# EAGLE design Domofon (EAGLE 9.4.2)
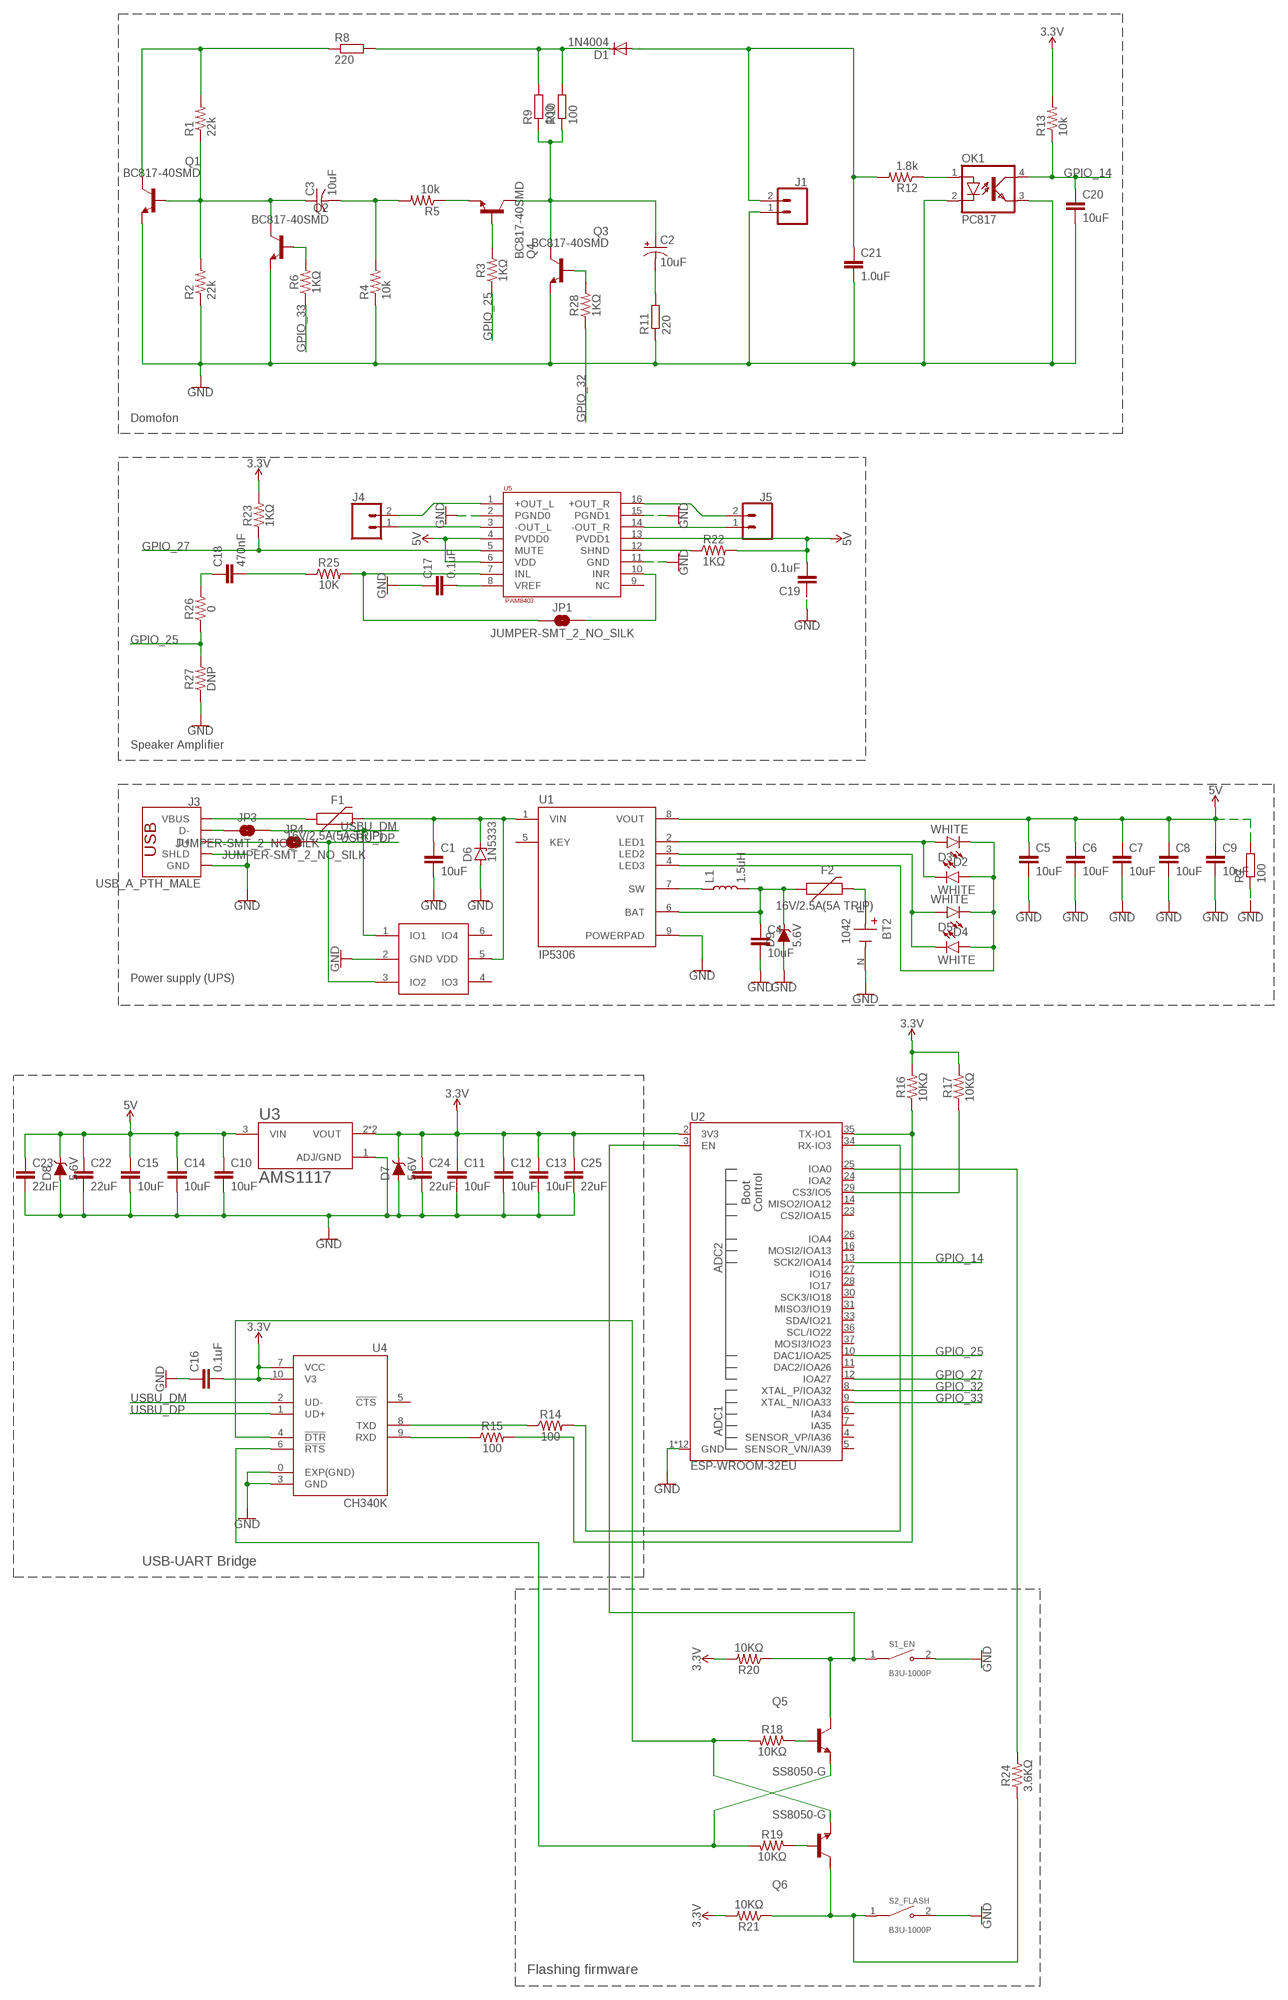
[diagram p0: schematic, sheet 1]

## Parts
BT2  1042  [BAT_1042]
C1  10uF  10UF-0603-6.3V-20%  [0603]
C2  10uF  10UF-POLAR-RADIAL-2.5MM-25V-20%  [CPOL-RADIAL-2.5MM-5MM]
C3  10uF  C-US025-024X044  [C025-024X044]
C4  10uF  10UF-0603-6.3V-20%  [0603]
C5  10uF  10UF-0603-6.3V-20%  [0603]
C6  10uF  10UF-0603-6.3V-20%  [0603]
C7  10uF  10UF-0603-6.3V-20%  [0603]
C8  10uF  10UF-0603-6.3V-20%  [0603]
C9  10uF  10UF-0603-6.3V-20%  [0603]
C10  10uF  10UF-0603-6.3V-20%  [0603]
C11  10uF  10UF-0603-6.3V-20%  [0603]
C12  10uF  10UF-0603-6.3V-20%  [0603]
C13  10uF  10UF-0603-6.3V-20%  [0603]
C14  10uF  10UF-0603-6.3V-20%  [0603]
C15  10uF  10UF-0603-6.3V-20%  [0603]
C16  0.1uF  0.1UF-0402-10V-10%-X7R  [0402]
C17  0.1uF  0.1UF-0402-10V-10%-X7R  [0402]
C18  470nF  470NF-0402-16V-10%  [0402]
C19  0.1uF  0.1UF-0402-10V-10%-X7R  [0402]
C20  10uF  10UF-0603-6.3V-20%  [0603]
C21  1.0uF  1.0UF-0603-16V-10%  [0603]
C22  22uF  22UF-1206-50V-10%  [1206]
C23  22uF  22UF-1206-50V-10%  [1206]
C24  22uF  22UF-1206-50V-10%  [1206]
C25  22uF  22UF-1206-50V-10%  [1206]
D1  1N4004  [DO41-10]
D2  WHITE  LED-WHITE0603  [LED-0603]
D3  WHITE  LED-WHITE0603  [LED-0603]
D4  WHITE  LED-WHITE0603  [LED-0603]
D5  WHITE  LED-WHITE0603  [LED-0603]
D6  1N5333  [C1702-15]
D7  5.6V  DIODE-ZENER-MMSZ5232BS  [SOD-323]
D8  5.6V  DIODE-ZENER-MMSZ5232BS  [SOD-323]
D9  5.6V  DIODE-ZENER-MMSZ5232BS  [SOD-323]
F1  16V/2.5A(5A TRIP)  PPTC_16V_2.5A  [1812]
F2  16V/2.5A(5A TRIP)  PPTC_16V_2.5A  [1812]
J1  CONN_02POLAR_LOCK  [MOLEX-1X2_LOCK]
J3  USB_A_PTH_MALE  [USB-A-H]
J4  CONN_02LOCK_LONGPADS  [1X02_LOCK_LONGPADS]
J5  CONN_02LOCK_LONGPADS  [1X02_LOCK_LONGPADS]
JP1  JUMPER-SMT_2_NO_SILK  [SMT-JUMPER_2_NO_SILK]
JP3  JUMPER-SMT_2_NO_SILK  [SMT-JUMPER_2_NO_SILK]
JP4  JUMPER-SMT_2_NO_SILK  [SMT-JUMPER_2_NO_SILK]
L1  1.5uH  1.5UH-2X2-1.4A  [INDUCTOR_2X2]
OK1  PC817  [DIL04]
Q1  BC817-40SMD  [SOT23-BEC]
Q2  BC817-40SMD  [SOT23-BEC]
Q3  BC817-40SMD  [SOT23-BEC]
Q4  BC817-40SMD  [SOT23-BEC]
Q5  SS8050-G  [TRANS_SS8050-G]
Q6  SS8050-G  [TRANS_SS8050-G]
R1  22k  22KOHM-0603-1/10W-1%  [0603]
R2  22k  22KOHM-0603-1/10W-1%  [0603]
R3  1KΩ  1KOHM-0402T-1/16W-1%  [0402-TIGHT]
R4  10k  10KOHM-0603-1/10W-1%  [0603]
R5  10k  10KOHM-0603-1/10W-1%  [0603]
R6  1KΩ  1KOHM-0402T-1/16W-1%  [0402-TIGHT]
R7  100  R-EU_0411/15  [0411/15]
R8  220  R-EU_0411/15  [0411/15]
R9  100  R-EU_0411/15  [0411/15]
R10  100  R-EU_0411/15  [0411/15]
R11  220  R-EU_0411/15  [0411/15]
R12  1.8k  1.8KOHM-0603-1/10W-1%  [0603]
R13  10k  10KOHM-0603-1/10W-1%  [0603]
R14  100  100OHM-0402-TIGHT-1/16W-1%  [0402-TIGHT]
R15  100  100OHM-0402-TIGHT-1/16W-1%  [0402-TIGHT]
R16  10KΩ  10KOHM-0402T-1/16W-1%  [0402-TIGHT]
R17  10KΩ  10KOHM-0402T-1/16W-1%  [0402-TIGHT]
R18  10KΩ  10KOHM-0402T-1/16W-1%  [0402-TIGHT]
R19  10KΩ  10KOHM-0402T-1/16W-1%  [0402-TIGHT]
R20  10KΩ  10KOHM-0402T-1/16W-1%  [0402-TIGHT]
R21  10KΩ  10KOHM-0402T-1/16W-1%  [0402-TIGHT]
R22  1KΩ  1KOHM-0402T-1/16W-1%  [0402-TIGHT]
R23  1KΩ  1KOHM-0402T-1/16W-1%  [0402-TIGHT]
R24  3.6KΩ  10KOHM-0402T-1/16W-1%  [0402-TIGHT]
R25  10K  10KOHM-0402-1/10W-0.1%  [0402-TIGHT]
R26  0  1KOHM-0603-1/10W-1%  [0603]
R27  DNP  1KOHM-0603-1/10W-1%  [0603]
R28  1KΩ  1KOHM-0402T-1/16W-1%  [0402-TIGHT]
S1_EN  B3U-1000P  [SW_B3U-1000P]
S2_FLASH  B3U-1000P  [SW_B3U-1000P]
U1  IP5306  [SOP127P600X165-9N]
U2  ESP-WROOM-32EU  [ESP-WROOM-32EU]
U3  AMS1117  [SOT229P700X180-4N]
U4  CH340K  [SOP100P600X160-11N]
U5  PAM8403  [SOP-16]
U6  AZC099-04S  [SOT95P275X110-6N]

## Nets
3.3V: C11.1 C12.1 C13.1 C16.2 C24.1 C25.1 D7.C R13.2 R16.2 R17.2 R20.2 R21.2 R23.2 U2.2(3V3) U3.2(VOUT) U3.4(VOUT) U4.7(VCC) U4.10(V3)
5V: C5.1 C6.1 C7.1 C8.1 C9.1 C10.1 C14.1 C15.1 C19.2 C22.1 C23.1 D8.C R7.2 R22.2 U1.8(VOUT) U3.3(VIN) U5.4(PVDD0) U5.6(VDD) U5.13(PVDD1)
GND: BT2.N(NEG) C1.2 C4.2 C5.2 C6.2 C7.2 C8.2 C9.2 C10.2 C11.2 C12.2 C13.2 C14.2 C15.2 C16.1 C17.1 C19.1 C20.2 C21.2 C22.2 C23.2 C24.2 C25.2 D6.A D7.A D8.A D9.A J1.1 J3.GND J3.SHLD1(SHLD) J3.SHLD2(SHLD) OK1.2(C) OK1.3(EMIT) Q1.E Q2.E Q3.E R2.1 R4.1 R7.1 R11.1 R27.1 S1_EN.2 S2_FLASH.2 U1.9(POWERPAD) U2.1(GND) U2.15(GND) U2.38(GND) U2.GND U2.GNDT1(GND) U2.GNDT2(GND) U2.GNDT3(GND) U2.GNDT4(GND) U2.GNDT5(GND) U2.GNDT6(GND) U2.GNDT7(GND) U2.GNDT8(GND) U3.1(ADJ/GND) U4.0(EXP(GND)) U4.3(GND) U5.2(PGND0) U5.11(GND) U5.15(PGND1) U6.2(GND)
GPIO_14: C20.1 OK1.4(COL) R13.1 U2.13(SCK2/IOA14)
GPIO_25: R3.1 R26.1 R27.2 U2.10(DAC1/IOA25)
GPIO_27: R23.1 U2.12(IOA27) U5.5(MUTE)
GPIO_32: R28.1 U2.8(XTAL_P/IOA32)
GPIO_33: R6.1 U2.9(XTAL_N/IOA33)
N$1: C3.1 Q1.B Q2.C R1.1 R2.2
N$2: OK1.1(A) R12.1
N$3: Q1.C R1.2 R8.1
N$4: Q2.B R6.2
N$5: C1.1 D6.C F1.2 U1.1(VIN) U6.5(VDD)
N$6: C3.2 R4.2 R5.2
N$7: D2.A D3.C U1.2(LED1)
N$8: Q4.E R5.1
N$9: Q4.B R3.2
N$10: D2.C D3.A D4.C D5.A U1.4(LED3)
N$11: C2.1(+) Q3.C Q4.C R9.1 R10.1
N$12: Q3.B R28.2
N$13: D4.A D5.C U1.3(LED2)
N$14: Q6.2(E) R18.2 U4.4(!DTR)
N$15: D1.C R8.2 R9.2 R10.2
N$16: C2.2(-) R11.2
N$17: L1.P$1 U1.7(SW)
N$18: C21.1 D1.A J1.2 R12.2
N$19: C4.1 D9.C F2.1 L1.P$2 U1.6(BAT)
N$20: Q5.2(E) R19.2 U4.6(!RTS)
N$21: J3.D- JP3.1
N$22: J3.D+ JP4.1
N$23: R15.2 R16.1 U2.35(TX-IO1)
N$24: R14.2 U2.34(RX-IO3)
N$25: R17.1 U2.29(CS3/IO5)
N$26: Q6.1(B) R19.1
N$27: Q5.1(B) R18.1
N$28: R24.2 U2.25(IOA0)
N$29: Q5.3(C) R20.1 S1_EN.1 U2.3(EN)
N$30: J4.1 U5.3(-OUT_L)
N$31: J4.2 U5.1(+OUT_L)
N$32: J5.1 U5.14(-OUT_R)
N$33: J5.2 U5.16(+OUT_R)
N$34: R22.1 U5.12(SHND)
N$35: Q6.3(C) R21.1 R24.1 S2_FLASH.1
N$36: C17.2 U5.8(VREF)
N$37: JP1.1 R25.2 U5.7(INL)
N$38: R14.1 U4.8(TXD)
N$39: R15.1 U4.9(RXD)
N$40: C18.2 R25.1
N$41: JP1.2 U5.10(INR)
N$42: C18.1 R26.2
N$43: F1.1 J3.VBUS
N$44: BT2.P(POS) F2.2
USBU_DM: JP3.2 U4.2(UD-) U6.1(IO1)
USBU_DP: JP4.2 U4.1(UD+) U6.3(IO2)
Unconnected: U1.5(KEY) U2.4(SENSOR_VP/IA36) U2.5(SENSOR_VN/IA39) U2.6(IA34) U2.7(IA35) U2.11(DAC2/IOA26) U2.14(MISO2/IOA12) U2.16(MOSI2/IOA13) U2.23(CS2/IOA15) U2.24(IOA2) U2.26(IOA4) U2.27(IO16) U2.28(IO17) U2.30(SCK3/IO18) U2.31(MISO3/IO19) U2.33(SDA/IO21) U2.36(SCL/IO22) U2.37(MOSI3/IO23) U4.5(!CTS) U5.9(NC) U6.4(IO3) U6.6(IO4)

## Notes on the sheet
- Domofon
- Speaker Amplifier
- Power supply (UPS)
- USB-UART Bridge
- Flashing firmware

## Library data of the parts
BT2 = 1042:1042: Check availability <https://pricing.snapeda.com/parts/1042/Keystone%20Electronics%20Corp./view-part?ref=eda>; AVAILABILITY: In Stock; CHECK_PRICES: https://www.snapeda.com/parts/1042/Keystone/view-part/?ref=eda; DESCRIPTION: SMT Holder for 18650 Battery; MF: Keystone Electronics Corp.; MP: 1042; PACKAGE: NON STANDARD-5 Keystone; PRICE: None; SNAPEDA_LINK: https://www.snapeda.com/parts/1042/Keystone/view-part/?ref=snap
C1 C4-C15 C20 = SparkFun-Capacitors:10UF: 10.0µF ceramic capacitors A capacitor is a passive two-terminal electrical component used to store electrical energy temporarily in an electric field.; PCBWAY_MPN: GRM185R60J106ME15D; PROD_ID: CAP-11015
C2 = SparkFun-Capacitors:10UF-POLAR: 10.0µF polarized capacitors A capacitor is a passive two-terminal electrical component used to store electrical energy temporarily in an electric field.; PROD_ID: CAP-08440
C3 = resistor:C-US: CAPACITOR, American symbol
C16 C17 C19 = SparkFun-Capacitors:0.1UF: 0.1µF ceramic capacitors A capacitor is a passive two-terminal electrical component used to store electrical energy temporarily in an electric field.; PROD_ID: CAP-15083
C18 = SparkFun-Capacitors:470NF: 0.47uF/470nF ceramic capacitors A capacitor is a passive two-terminal electrical component used to store electrical energy temporarily in an electric field.; PROD_ID: CAP-09041
C21 = SparkFun-Capacitors:1.0UF: 1µF ceramic capacitors A capacitor is a passive two-terminal electrical component used to store electrical energy temporarily in an electric field.; PROD_ID: CAP-00868
C22-C25 = SparkFun-Capacitors:22UF: 22µF ceramic capacitors A capacitor is a passive two-terminal electrical component used to store electrical energy temporarily in an electric field.; PROD_ID: CAP-15263
D1 = diode:1N4004: DIODE general purpose rectifier, 1 A
D2-D5 = SparkFun-LED:LED-WHITE: White SMD LED Used in manufacturing several products at SparkFun. Packages: 0603 - Bright White SMD 0603 package[Product Link] <http://www.kingbrightusa.com/product.asp?catalog_name=LED&product_id=APT1608QWF/D> 1206 - Bright White SMD1206 package [Product Link] <http://www.kingbrightusa.com/product.asp?catalog_name=LED&product_id=APT3216QWF/D> 3014 - Super Bright SMD 3014 package [Datasheet] <http://www.lumileds.com/uploads/459/DS208-pdf> SparkFun Products: Blackberry Trackballer Breakout <https://www.sparkfun.com/products/13169> Digital SandBox <https://www.sparkfun.com/products/12651>; PROD_ID: DIO-09004
D6 = diode:1N5333: Z DIODE 3.3 V, 5W, 5 percent (Motorola)
D7-D9 = SparkFun-DiscreteSemi:DIODE-ZENER: Zener Diode A Zener diode allows current to flow from its anode to its cathode like a normal semiconductor diode, but it also permits current to flow in the reverse direction when its "Zener voltage" is reached. - WIkipedia; PROD_ID: DIO-12442
F1 F2 = SparkFun-Fuses:PPTC: Resettable Fuse PPTC Resettable Fuse. Really a sort of resistor with a polymeric positive temperature coefficient whose resistance increases dramatically with an increase in temperature. When heated by the power passing through the resistance rises causing the current to be limited, protecting the circuit. This is achieved by the transition of the polymer from a crystalline to an amorphous state where the conductive carbon separates breaking the conductive pathways found in the cool crystalline structure. When a PPTC cools back down it resumes conducting letting the circuit turn back on. SparkFun Products: SparkFun RedBoard - Programmed with Arduino <https://www.sparkfun.com/products/12757> Pro Micro - 5V/16MHz <https://www.sparkfun.com/products/12640> Arduino Pro 328 - 5V/16MHz <https://www.sparkfun.com/products/10915> MP3 Trigger <https://www.sparkfun.com/products/13720>; PROD_ID: RES-14390
J1 = SparkFun-Connectors:CONN_02: Multi connection point. Often used as Generic Header-pin footprint for 0.1 inch spaced/style header connections On any of the 0.1 inch spaced packages, you can populate with these: Break Away Headers - Straight <https://www.sparkfun.com/products/116> (PRT-00116) Break Away Male Headers - Right Angle <https://www.sparkfun.com/products/553> (PRT-00553) Female Headers <https://www.sparkfun.com/products/115> (PRT-00115) Break Away Headers - Machine Pin <https://www.sparkfun.com/products/117> (PRT-00117) Break Away Female Headers - Swiss Machine Pin <https://www.sparkfun.com/products/743> (PRT-00743) For SCREWTERMINALS and SPRING TERMINALS visit here: Screw Terimnals on SparkFun.com <https://www.sparkfun.com/search/results?term=Screw+Terminals> (5mm/3.5mm/2.54mm spacing) This device is also useful as a general connection point to wire up your design to another part of your project. Our various solder wires solder well into these plated through hole pads. Hook-Up Wire - Assortment (Stranded, 22 AWG) <https://www.sparkfun.com/products/11375> (PRT-11375) Hook-Up Wire - Assortment (Solid Core, 22 AWG) <https://www.sparkfun.com/products/11367> (PRT-11367) View the entire wire category on our website here <https://www.sparkfun.com/categories/141> Special notes: Molex polarized connector foot print use with: PRT-08233 with associated crimp pins and housings. 2.54_SCREWTERM for use with PRT-10571. 3.5mm Screw Terminal footprints for PRT-08084 5mm Screw Terminal footprints for use with PRT-08432; SF_ID: PRT-09918
J3 = SparkFun-Connectors:USB_A: USB-A Connector Male and female variants, as well as PTH and SMT variants SparkFun Products: SparkFun XBee Explorer Dongle <https://www.sparkfun.com/products/11697> PTH Male SparkFun MicroView-USB Programmer <https://www.sparkfun.com/products/12924> SMT Male SparkFun USB Type A Female Breakout <https://www.sparkfun.com/products/12700> SMT Female; PROD_ID: CONN-08367; SF_ID: PRT-00437
J4 J5 = SparkFun-Connectors:CONN_02: Multi connection point. Often used as Generic Header-pin footprint for 0.1 inch spaced/style header connections On any of the 0.1 inch spaced packages, you can populate with these: Break Away Headers - Straight <https://www.sparkfun.com/products/116> (PRT-00116) Break Away Male Headers - Right Angle <https://www.sparkfun.com/products/553> (PRT-00553) Female Headers <https://www.sparkfun.com/products/115> (PRT-00115) Break Away Headers - Machine Pin <https://www.sparkfun.com/products/117> (PRT-00117) Break Away Female Headers - Swiss Machine Pin <https://www.sparkfun.com/products/743> (PRT-00743) For SCREWTERMINALS and SPRING TERMINALS visit here: Screw Terimnals on SparkFun.com <https://www.sparkfun.com/search/results?term=Screw+Terminals> (5mm/3.5mm/2.54mm spacing) This device is also useful as a general connection point to wire up your design to another part of your project. Our various solder wires solder well into these plated through hole pads. Hook-Up Wire - Assortment (Stranded, 22 AWG) <https://www.sparkfun.com/products/11375> (PRT-11375) Hook-Up Wire - Assortment (Solid Core, 22 AWG) <https://www.sparkfun.com/products/11367> (PRT-11367) View the entire wire category on our website here <https://www.sparkfun.com/categories/141> Special notes: Molex polarized connector foot print use with: PRT-08233 with associated crimp pins and housings. 2.54_SCREWTERM for use with PRT-10571. 3.5mm Screw Terminal footprints for PRT-08084 5mm Screw Terminal footprints for use with PRT-08432
JP1 JP3 JP4 = SparkFun-Jumpers:JUMPER-SMT_2_NO: Normally open jumper This jumper has two pads in close proximity to each other. Apply solder to close the connection. Round pads are easier to solder for beginners, but are a lot larger. SparkFun Product that uses the round pads: SparkFun EL Sequencer <https://www.sparkfun.com/products/12781>
L1 = SparkFun-Coils:1.5UH: FIXED IND 1.5UH 1.4A 120 MOHM; PROD_ID: NDUC-15405
OK1 = optocoupler:PC817: SHARP OPTO COUPLER; MPN: PC817X4J000F; OC_FARNELL: 9707727; OC_NEWARK: 97K7059
Q1-Q4 = transistor-npn:BC817*: NPN Transistor
Q5 Q6 = SS8050-G:SS8050-G: Bipolar (BJT) Transistor NPN 25 V 1.5 A 100MHz 300 mW Surface Mount SOT-23-3 Check availability <https://pricing.snapeda.com/parts/SS8050-G/Comchip%20Technology/view-part?ref=eda>; AVAILABILITY: In Stock; DESCRIPTION: Bipolar (BJT) Transistor NPN 25 V 1.5 A 100MHz 300 mW Surface Mount SOT-23-3; MF: Comchip Technology; MP: SS8050-G; PACKAGE: TO-236-3 Comchip Technology; PCBWAY_MPN: SS8050-G; PRICE: None; PURCHASE-URL: https://pricing.snapeda.com/search/part/SS8050-G/?ref=eda
R1 R2 = SparkFun-Resistors:22KOHM: 22kΩ resistor A resistor is a passive two-terminal electrical component that implements electrical resistance as a circuit element. Resistors act to reduce current flow, and, at the same time, act to lower voltage levels within circuits. - Wikipedia; PROD_ID: RES-07853
R3 R6 R22 R23 R28 = SparkFun-Resistors:1KOHM: 1kΩ resistor A resistor is a passive two-terminal electrical component that implements electrical resistance as a circuit element. Resistors act to reduce current flow, and, at the same time, act to lower voltage levels within circuits. - Wikipedia; PCBWAY_MPN: RC0402JR-071KL; PROD_ID: RES-14342; VALUE: 1k
R4 R5 R13 = SparkFun-Resistors:10KOHM: 10kΩ resistor A resistor is a passive two-terminal electrical component that implements electrical resistance as a circuit element. Resistors act to reduce current flow, and, at the same time, act to lower voltage levels within circuits. - Wikipedia; PROD_ID: RES-00824
R7-R11 = resistor:R-EU_: RESISTOR, European symbol
R12 = SparkFun-Resistors:1.8KOHM: 1.8kΩ resistor A resistor is a passive two-terminal electrical component that implements electrical resistance as a circuit element. Resistors act to reduce current flow, and, at the same time, act to lower voltage levels within circuits. - Wikipedia; PROD_ID: RES-09119
R14 R15 = SparkFun-Resistors:100OHM: 100Ω resistor A resistor is a passive two-terminal electrical component that implements electrical resistance as a circuit element. Resistors act to reduce current flow, and, at the same time, act to lower voltage levels within circuits. - Wikipedia; PCBWAY_MPN: RC0402JR-071KL; PROD_ID: RES-14962
R16-R21 = SparkFun-Resistors:10KOHM: 10kΩ resistor A resistor is a passive two-terminal electrical component that implements electrical resistance as a circuit element. Resistors act to reduce current flow, and, at the same time, act to lower voltage levels within circuits. - Wikipedia; PCBWAY_MPN: RC0402JR-0710KL; PROD_ID: RES-14241; VALUE: 10k
R24 = SparkFun-Resistors:10KOHM: 10kΩ resistor A resistor is a passive two-terminal electrical component that implements electrical resistance as a circuit element. Resistors act to reduce current flow, and, at the same time, act to lower voltage levels within circuits. - Wikipedia; PCBWAY_MPN: RC0402FR-073K6L; PROD_ID: RES-14241; VALUE: 10k
R25 = SparkFun-Resistors:10KOHM: 10kΩ resistor A resistor is a passive two-terminal electrical component that implements electrical resistance as a circuit element. Resistors act to reduce current flow, and, at the same time, act to lower voltage levels within circuits. - Wikipedia; PROD_ID: RES-16147
R26 R27 = SparkFun-Resistors:1KOHM: 1kΩ resistor A resistor is a passive two-terminal electrical component that implements electrical resistance as a circuit element. Resistors act to reduce current flow, and, at the same time, act to lower voltage levels within circuits. - Wikipedia; PROD_ID: RES-07856; VALUE: 1k
S1_EN S2_FLASH = B3U-1000P:B3U-1000P: Switch Tactile N.O. SPST Round Button Gull Wing 0.05A 12VDC 1.5N SMD Embossed T/R Check availability <https://pricing.snapeda.com/parts/B3U-1000P/Omron/view-part?ref=eda>; AVAILABILITY: In Stock; DESCRIPTION: Tactile Switch SPST-NO Top Actuated Surface Mount; MF: Omron; MP: B3U-1000P; PACKAGE: Custom Package Omron; PCBWAY_MPN: B3U-1000P; PRICE: None; PURCHASE-URL: https://pricing.snapeda.com/search/part/B3U-1000P/?ref=eda
U1 = IP5306:IP5306: Check availability <https://pricing.snapeda.com/parts/IP5306/Injoinic/view-part?ref=eda>; AVAILABILITY: In Stock; CHECK_PRICES: https://www.snapeda.com/parts/IP5306/Injoinic/view-part/?ref=eda; DESCRIPTION: Fully-Integrated Power Bank System-On-Chip with 2.1A charger, 2.4A discharger; MF: Injoinic; MP: IP5306; PACKAGE: eSOP8 INJOINIC; PRICE: None; SNAPEDA_LINK: https://www.snapeda.com/parts/IP5306/Injoinic/view-part/?ref=snap
U2 = SparkFun-RF:ESP-WROOM-32: ESP-WROOM-32D - trace antenna (includes keepout) ESP-WROOM-32U - U.FL antenna connector Includes both "standard" footprints and "narrow" version (for use with tighter layouts).; PCBWAY_MPN: ESP-WROOM-32E(4MB); PROD_ID: IC-15442
U3 = AMS1117:AMS1117: Sot223/Pkg 1-Amp 5-Volt Low Drop Out Voltage Regulatator Check availability <https://pricing.snapeda.com/parts/AMS1117/Advanced%20Monolithic%20Systems/view-part?ref=eda>; AVAILABILITY: Not in stock; DESCRIPTION: 1A LOW DROPOUT VOLTAGE REGULATOR SOT-223; MF: Advanced Monolithic Systems; MP: AMS1117; PACKAGE: SOT-223 Seeed Technology; PCBWAY_MPN: AMS1117-3.3; PRICE: None
U4 = CH340K:CH340K: Check availability <https://pricing.snapeda.com/parts/CH340K/WCH/view-part?ref=eda>; AVAILABILITY: Not in stock; CHECK_PRICES: https://www.snapeda.com/parts/CH340K/WCH/view-part/?ref=eda; DESCRIPTION: USB to Serial Port Chip; MF: WCH; MP: CH340K; PACKAGE: Package; PRICE: None; SNAPEDA_LINK: https://www.snapeda.com/parts/CH340K/WCH/view-part/?ref=snap
U5 = PAM8403:PAM8403: Check availability <https://pricing.snapeda.com/parts/PAM8403/Diodes%20Zetex/view-part?ref=eda>; AVAILABILITY: In Stock; CHECK_PRICES: https://www.snapeda.com/parts/PAM8403/Diodes+Inc./view-part/?ref=eda; DESCRIPTION: Audio Amp Speaker 2-CH Stereo 3.2W Class-D 16-Pin SOP T/R; MF: Diodes Zetex; MP: PAM8403; PACKAGE: None; PRICE: None; PURCHASE-URL: https://www.snapeda.com/api/url_track_click_mouser/?unipart_id=12621970&manufacturer=Diodes Zetex&part_name=PAM8403&search_term=pam8403; SNAPEDA_LINK: https://www.snapeda.com/parts/PAM8403/Diodes+Inc./view-part/?ref=snap
U6 = SamacSys_Parts:AZC099-04S

## Net classes
0 default: width 0.457 mm, clearance 0.406 mm

## Board
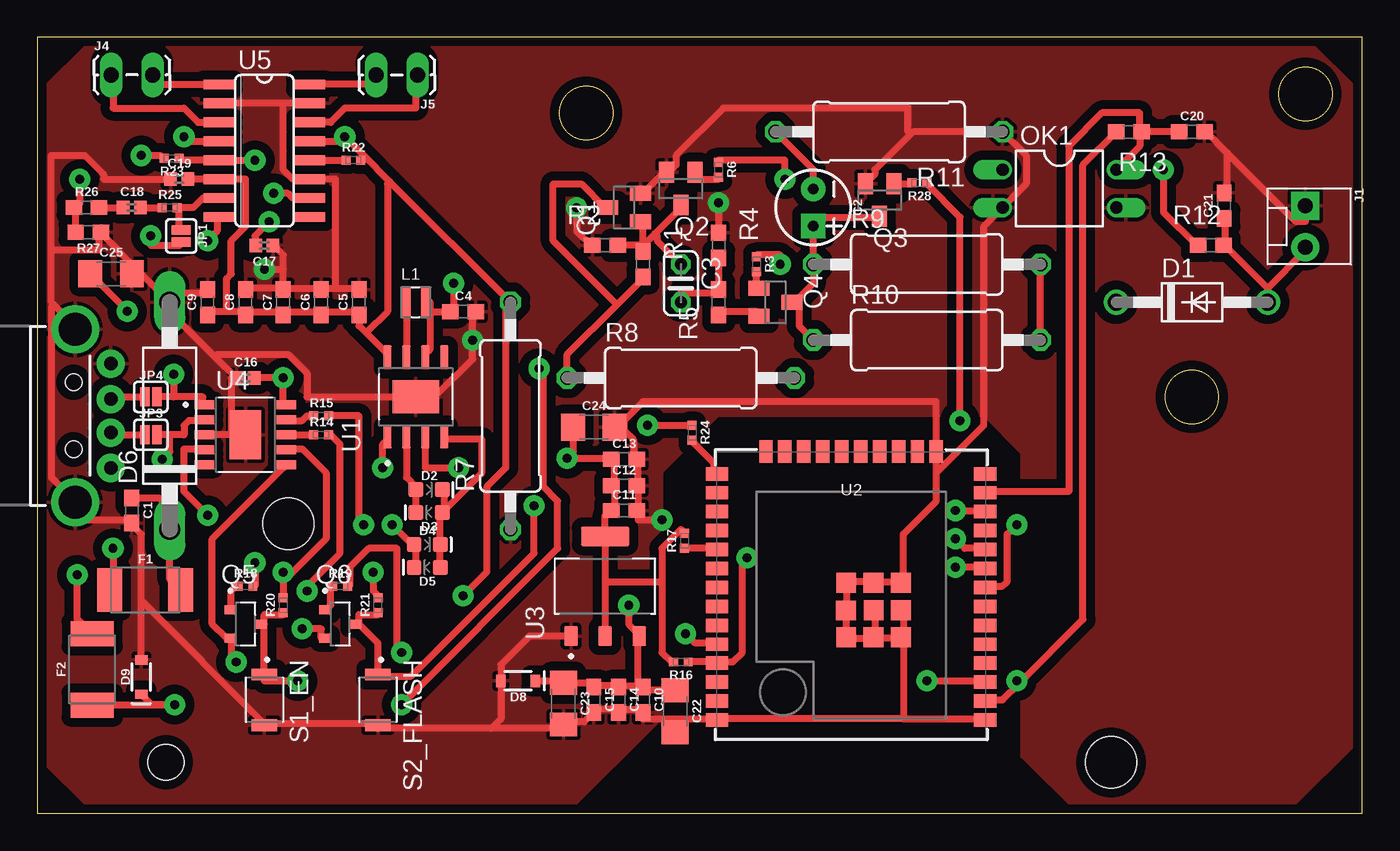
[diagram p1: board, top side]
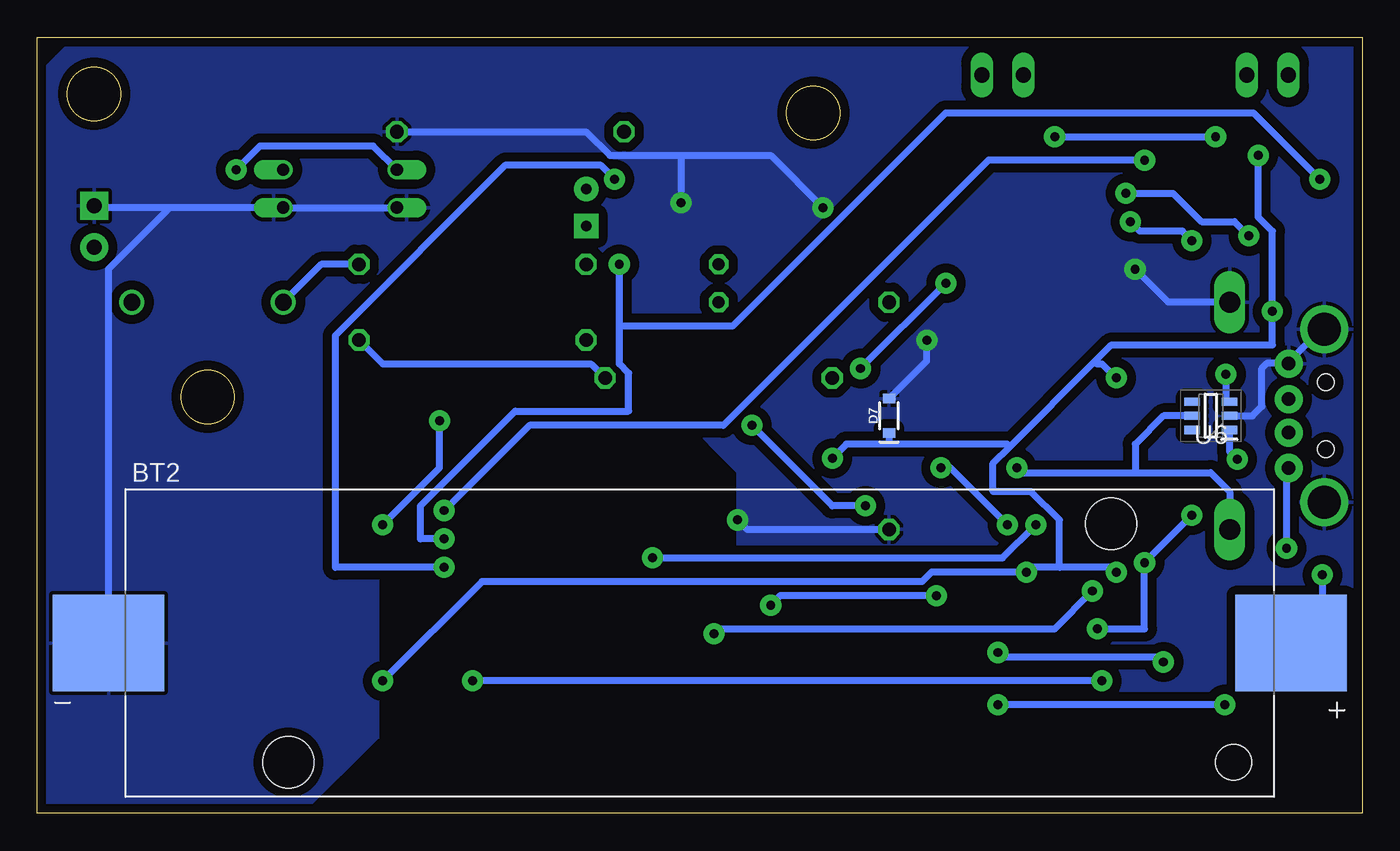
[diagram p2: board, bottom side, seen from below]

Size 88.9 x 52.06 mm. Coordinates in mm from the lower left corner, seen from the top.
Outline: 0,0 88.9,0 88.9,52.06 0,52.06 0,0
Outline: circle at 85.09,48.26 radius 1.8
Outline: circle at 36.83,46.99 radius 1.8
Outline: circle at 77.47,27.94 radius 1.8
Copper layers (1*16): Top 0.035mm / dielectric 1.5mm / Bottom 0.035mm
Design rules "default *": minimum track width 7mil, minimum drill 0.6mm, track to track 7mil, track to pad 7mil, pad to pad 7mil, via to via 7mil, smd to smd 7mil, copper to edge 20mil, drill to drill 6mil, minimum pad ring 10mil, minimum via ring 16mil, stop-mask expansion 4mil, vias tented up to drill 40mil, thermal gap 10mil

### Footprints (pad centres in the part's own frame; a part is rotated, then mirrored left to right if it is on the bottom)
BAT_1042 = smd 7.46 x 6.47: N -39.67,0; P 39.67,0 | hole 3.45: 27.6,8; -27.6,-8 | hole 2.39: 35.82,-8
0603 = smd 1.1 x 1: 1 -0.85,0; 2 0.85,0
CPOL-RADIAL-2.5MM-5MM = drill 0.7 pad 1.651 square: 1 1.25,0 | drill 0.7 pad 1.651: 2 -1.25,0
C025-024X044 = drill 0.813 octagon: 1 -1.27,0; 2 1.27,0
0402 = smd 0.85 x 0.9: 1 -0.58,0; 2 0.58,0
1206 = smd 1.6 x 1.8: 1 -1.4,0; 2 1.4,0
DO41-10 = drill 1.118: A 5.08,0; C -5.08,0
LED-0603 = smd 1 x 1: A -0.877,0; C 0.877,0
C1702-15 = drill 1.397 long: A 7.62,0; C -7.62,0
SOD-323 = smd 0.63 x 0.83: A 1.15,0; C -1.15,0
1812 = smd 1.676 x 2.896: 1 -2.388,0; 2 2.388,0
MOLEX-1X2_LOCK = drill 1.016 pad 1.88 square: 1 -0.127,0 | drill 1.016 pad 1.88: 2 2.667,0
USB-A-H = drill 0.914 pad 1.88: D+ 2.4,1.127; D- 2.4,-1.127; GND 2.4,3.5; VBUS 2.4,-3.5 | drill 2.2: SHLD1 0,-5.8; SHLD2 0,5.8 | hole 1.1: -0.1,2.25; -0.1,-2.25
1X02_LOCK_LONGPADS = drill 1.016 long: 1 -0.127,0; 2 2.667,0
SMT-JUMPER_2_NO_SILK = smd 0.635 x 1.27: 1 -0.406,0; 2 0.406,0
INDUCTOR_2X2 = smd 0.65 x 2: P$1 -0.675,0; P$2 0.675,0
DIL04 = drill 0.813 offset: 1 -1.27,-3.81; 2 1.27,-3.81; 3 1.27,3.81; 4 -1.27,3.81
SOT23-BEC = smd 1 x 1.4: B -0.95,-1.1; C 0,1.1; E 0.95,-1.1
TRANS_SS8050-G = smd 0.8 x 0.6: 1 -1.01,0.95; 2 -1.01,-0.95; 3 1.01,0
0402-TIGHT = smd 0.6 x 0.6: 1 -0.5,0; 2 0.5,0
0411/15 = drill 0.914 octagon: 1 -7.62,0; 2 7.62,0
SW_B3U-1000P = smd 0.8 x 1.7: 1 -1.7,0; 2 1.7,0
SOP127P600X165-9N = smd 1.61 x 0.59: 1 -2.655,1.905; 2 -2.655,0.635; 3 -2.655,-0.635; 4 -2.655,-1.905; 5 2.655,-1.905; 6 2.655,-0.635; 7 2.655,0.635; 8 2.655,1.905 | smd 2.21 x 3.1: 9 0,0
ESP-WROOM-32EU = smd 0.9 x 1.5: 1 7.7,9; 2 6.43,9; 3 5.16,9; 4 3.89,9; 5 2.62,9; 6 1.35,9; 7 0.08,9; 8 -1.19,9; 9 -2.46,9; 10 -3.73,9; 11 -5,9; 12 -6.27,9; 13 -7.54,9; 14 -8.81,9; 25 -8.81,-9; 26 -7.54,-9; 27 -6.27,-9; 28 -5,-9; 29 -3.73,-9; 30 -2.46,-9; 31 -1.19,-9; 32 0.08,-9; 33 1.35,-9; 34 2.62,-9; 35 3.89,-9; 36 5.16,-9; 37 6.43,-9; 38 7.7,-9 | smd 1.5 x 0.9: 15 -10.3,5.715; 16 -10.3,4.445; 17 -10.3,3.175; 18 -10.3,1.905; 19 -10.3,0.635; 20 -10.3,-0.635; 21 -10.3,-1.905; 22 -10.3,-3.175; 23 -10.3,-4.445; 24 -10.3,-5.715 | smd 1.33 x 1.33: GND 0.339,1.515; GNDT1 -1.5,3.33; GNDT2 -1.51,1.5; GNDT3 -1.5,-0.33; GNDT4 0.36,-0.34; GNDT5 2.16,-0.33; GNDT6 2.16,1.5; GNDT7 2.16,3.33; GNDT8 0.33,3.33
SOT229P700X180-4N = smd 1.31 x 0.93: 1 -3.345,2.29; 2 -3.345,0; 3 -3.345,-2.29 | smd 1.31 x 3.24: 4 3.345,0
SOP100P600X160-11N = smd 2.1 x 3.3: 0 0,0 | smd 1.31 x 0.6: 1 -2.75,2; 2 -2.75,1; 3 -2.75,0; 4 -2.75,-1; 5 -2.75,-2; 6 2.75,-2; 7 2.75,-1; 8 2.75,0; 9 2.75,1; 10 2.75,2
SOP-16 = smd 2.032 x 0.66: 1 -3.073,4.445; 2 -3.073,3.175; 3 -3.073,1.905; 4 -3.073,0.635; 5 -3.073,-0.635; 6 -3.073,-1.905; 7 -3.073,-3.175; 8 -3.073,-4.445; 9 3.073,-4.445; 10 3.073,-3.175; 11 3.073,-1.905; 12 3.073,-0.635; 13 3.073,0.635; 14 3.073,1.905; 15 3.073,3.175; 16 3.073,4.445
SOT95P275X110-6N = smd 1.05 x 0.55: 1 -1.25,0.95; 2 -1.25,0; 3 -1.25,-0.95; 4 1.25,-0.95; 5 1.25,0; 6 1.25,0.95

### Placement (x,y rotation side)
BT2  44.45,11.43 0 bottom
C1  6.35,20.32 270 top
C2  52.07,40.64 270 top
C3  43.18,35.56 270 top
C4  28.57,33.66 0 top
C5  21.59,34.29 90 top
C6  19.05,34.29 90 top
C7  16.51,34.29 90 top
C8  13.97,34.29 90 top
C9  11.43,34.29 90 top
C10  40.64,7.62 270 top
C11  39.37,20.32 0 top
C12  39.37,21.97 0 top
C13  39.37,23.75 0 top
C14  38.99,7.62 270 top
C15  37.34,7.62 270 top
C16  13.97,29.21 0 top
C17  15.24,38.1 180 top
C18  6.35,40.64 0 top
C19  9.53,42.55 0 top
C20  77.47,45.72 0 top
C21  79.63,40.77 90 top
C22  42.8,6.86 270 top
C23  35.31,7.37 270 top
C24  37.34,25.91 0 top
C25  4.95,36.2 0 top
D1  77.47,34.29 0 top
D2  26.29,21.72 0 top
D3  26.29,20.19 180 top
D4  26.16,18.03 0 top
D5  26.16,16.51 180 top
D6  8.89,26.67 90 top
D7  31.75,26.67 90 bottom
D8  32.26,8.89 180 top
D9  6.99,9.14 90 top
F1  7.24,14.99 0 top
F2  3.68,9.65 90 top
J1  85.09,40.64 270 top
J3  2.54,26.67 0 top
J4  5.08,49.53 0 top
J5  25.4,49.53 180 top
JP1  9.65,38.73 270 top
JP3  7.62,25.4 0 top
JP4  7.62,27.94 0 top
L1  25.4,34.29 0 top
OK1  68.58,41.91 270 top
Q1  39.37,40.64 90 top
Q2  43.18,41.91 180 top
Q3  56.52,41.15 180 top
Q4  49.53,34.29 270 top
Q5  13.97,12.7 0 top
Q6  20.32,12.7 0 top
R1  40.64,36.83 270 top
R2  38.1,38.1 0 top
R3  48.26,36.83 270 top
R4  45.72,38.1 270 top
R5  45.72,34.29 90 top
R6  45.72,43.18 270 top
R7  31.75,26.67 90 top
R8  43.18,29.21 0 top
R9  59.69,36.83 0 top
R10  59.69,31.75 0 top
R11  57.15,45.72 180 top
R12  78.74,38.1 0 top
R13  73.24,45.72 180 top
R14  19.05,25.4 0 top
R15  19.05,26.67 0 top
R16  43.18,10.16 180 top
R17  43.43,18.29 90 top
R18  13.97,15.24 0 top
R19  20.32,15.24 0 top
R20  16.51,13.97 90 top
R21  22.86,13.97 90 top
R22  21.21,43.81 0 top
R23  9.02,43.94 180 top
R24  43.94,25.53 270 top
R25  8.89,40.64 0 top
R26  3.3,40.64 0 top
R27  3.43,38.99 180 top
R28  59.18,42.29 180 top
S1_EN  15.24,7.62 270 top
S2_FLASH  22.86,7.62 270 top
U1  25.4,27.94 90 top
U2  54.61,13.97 270 top
U3  38.1,15.24 90 top
U4  13.97,25.4 0 top
U5  15.24,44.45 0 top
U6  10.16,26.67 180 bottom

### Tracks (layer width: path | path; a pad name or v marks a point on that pad's centre or on a via)
3.3V  (via drill 0.6)
  Top 0.457: R13.2 70.17,43.5 70.17,13.02 65.88,8.73 | 65.88,8.73 64.77,7.62 63.82,7.62 U2.2 | 41.91,15.56 41.91,17.78 43.18,19.05 R17.2 | 41.91,15.56 41.91,10.79 42.55,10.16 R16.2 | 38.1,15.56 U3.4 38.1,20 38.42,20.32 C11.1 38.73,20.32 38.73,21.91 C12.1 38.73,22.23 38.73,23.49 C13.1 38.42,23.81 v35.56,23.81 35.94,24.19 C24.1 | 38.1,15.56 U3.2 | 38.1,15.56 41.91,15.56 | C16.2 v16.51,29.21 16.51,27.62 U4.10 | R20.2 16.51,15.56 16.99,16.03 | 16.99,16.03 19.37,18.41 19.37,22.86 17.78,24.45 16.83,24.45 U4.7 | v22.54,16.19 22.54,14.92 22.86,14.6 R21.2 | v16.51,16.19 16.83,16.19 16.99,16.03 | v6.99,44.13 8.26,44.13 R23.2 | v65.72,8.89 65.88,8.73 | C25.1 6.03,33.72 v6.03,33.67
  Bottom 0.457: 20.32,16.51 16.83,16.51 v16.51,16.19 | 20.32,16.51 22.23,16.51 v22.54,16.19 28.89,16.19 29.53,15.56 59.05,15.56 v65.72,8.89 | v6.99,44.13 6.99,40 6.03,39.05 v6.03,33.67 6.03,31.43 16.83,31.43 17.94,30.32 | 23.65,24.61 24.77,23.49 24.77,21.59 22.23,21.59 20.32,19.69 20.32,16.51 | 23.65,24.61 17.94,30.32 | v16.51,29.21 17.46,30.16 17.78,30.16 17.94,30.32 | v35.56,23.81 34.61,24.77 31.75,24.77 | 31.75,24.77 23.81,24.77 23.65,24.61 | D7.C 31.75,24.77
5V  (via drill 0.6)
  Top 0.457: C19.2 U5.6 13.97,42.55 13.97,39.37 13.02,38.42 13.02,36.2 12.7,35.88 12.7,33.66 | 13.97,33.66 12.7,33.66 | 12.7,33.66 11.43,33.66 C9.1 | 13.97,33.66 16.51,33.66 | 13.97,33.66 C8.1 | 16.51,33.66 19.05,33.66 | 16.51,33.66 C7.1 | 19.05,33.66 21.59,33.66 C5.1 21.59,32.7 22.07,32.23 | 19.05,33.66 C6.1 | 22.07,32.23 23.5,30.8 U1.8 | 37.47,8.57 38.73,8.57 C14.1 39.05,8.57 40.32,8.57 | 37.47,8.57 C15.1 | 40.32,8.57 40.64,8.57 | 40.64,8.57 C10.1 40.32,8.57 | 40.32,8.57 40.32,11.75 U3.3 40.32,12.06 39.69,12.7 v39.69,13.97 | 21.91,44.13 21.91,43.81 R22.2 | 21.91,44.13 20.95,45.09 20.64,45.09 | U5.13 20.64,45.09 | U5.4 9.84,45.09 v9.84,45.4 | 20.64,45.09 v20.64,45.4 | 21.91,44.13 23.65,42.39 | 23.65,42.39 R7.2 31.43,34.29 31.43,23.18 30.16,21.91 30.16,16.19 v28.57,14.6 | 22.07,32.23 23.5,33.66 23.5,42.23 23.65,42.39 | C22.1 40.95,8.26 40.64,8.57 | 37.47,8.57 37.27,8.77 C23.1 35.18,8.89 D8.C
  Bottom 0.457: v20.64,45.4 v9.84,45.4 | v39.69,13.97 39.05,14.6 v28.57,14.6
GND  (via drill 0.6)
  Top 0.457: 79.85,44.29 84.45,39.69 85.09,39.69 J1.1 | 79.85,44.29 78.42,45.72 C20.2 | Q1.E 40.64,41.59 42.23,43.18 Q2.E 42.55,43.18 42.86,43.5 42.86,44.13 46.04,47.31 58.42,47.31 58.42,45.72 58.58,45.56 | v36.2,40.64 36.2,39.05 37.15,38.1 R2.1 | v45.72,40.96 R4.1 | 58.58,45.56 58.74,45.72 R11.1 66.36,44.13 66.36,42.23 OK1.2 63.5,39.37 63.5,26.03 60.33,22.86 | 58.58,45.56 56.2,43.18 56.2,42.86 55.88,42.55 Q3.E | C19.1 4.45,42.55 4.45,42.86 3.17,44.13 0.95,44.13 0.95,37.78 | 0.95,37.78 0.95,34.29 1.11,34.13 | 1.11,34.13 2.54,32.7 J3.SHLD2 | 1.11,34.13 0.95,33.97 0.95,22.54 2.54,20.95 J3.SHLD1 2.54,19.69 6.35,19.69 C1.2 6.35,19.37 6.99,18.73 6.99,14.29 | U5.15 16.51,47.62 | 16.51,47.62 U5.2 | 16.51,35.24 16.51,36.51 | 16.51,36.51 16.51,37.46 15.88,38.1 C17.1 | 16.51,35.24 13.97,35.24 C8.2 | 16.51,35.24 19.05,35.24 | 16.51,35.24 C7.2 | 19.05,35.24 20,35.24 | 20,35.24 21.59,35.24 C5.2 | 19.05,35.24 C6.2 | 20,35.24 20,42.55 U5.11 17.14,42.55 16.51,43.18 16.51,47.62 | C4.2 29.21,33.66 v29.21,31.75 29.21,30.48 26.67,27.94 U1.9 18.1,27.94 18.1,29.53 16.83,30.8 12.06,30.8 11.91,30.64 | 13.02,25.4 U4.3 | 11.91,30.64 8.89,33.66 D6.A | 11.91,30.64 13.34,29.21 C16.1 13.02,29.21 13.02,25.4 | D6.A 8.89,34.92 11.43,34.92 C9.2 | D6.A 6.35,36.83 | 6.35,36.83 4.45,38.73 R27.1 4.13,38.73 4.13,37.78 0.95,37.78 | 13.02,25.4 U4.0 | v15.24,36.51 16.51,36.51 | 15.24,6.03 22.86,6.03 S2_FLASH.2 22.86,5.71 30.48,5.71 | U3.1 33.02,11.9 31.11,9.99 D8.A 31.11,6.34 30.48,5.71 | 35.05,6.13 36.7,6.13 C15.2 37.47,6.99 38.73,6.99 C14.2 39.05,6.99 40.64,6.99 C10.2 40.64,6.35 43.18,6.35 | 43.18,6.35 45.4,6.35 U2.38 45.72,6.35 58.1,6.35
  Top 0.457: 30.48,5.71 35.05,5.71 35.05,6.13 | U2.GNDT6 56.2,12.06 56.2,13.33 U2.GND | U2.GNDT7 58.1,12.06 58.1,13.33 U2.GNDT8 | 58.1,6.35 63.5,6.35 U2.1 | 58.1,6.35 58.1,11.75 U2.GNDT7 | U2.GNDT6 56.2,11.75 57.78,11.75 U2.GNDT7 | 40.32,20.32 40.32,21.91 C12.2 40.32,22.23 40.32,23.49 C13.2 40.01,23.81 40.01,25.08 39.37,25.72 39.37,26.35 | 60.33,22.86 60.33,20.95 58.1,18.73 58.1,15.56 U2.GNDT1 57.78,15.56 56.2,15.56 U2.GNDT2 55.88,15.56 54.29,15.56 U2.GNDT3 54.29,15.24 54.29,13.65 U2.GNDT4 54.29,13.33 54.29,12.06 U2.GNDT5 54.29,11.75 55.88,11.75 U2.GNDT6 | 60.33,22.86 U2.15 60.33,27.62 40.64,27.62 39.37,26.35 | v41.91,19.69 40.32,19.69 40.32,20.32 | 40.32,20.32 C11.2 | 15.24,6.03 6.99,14.29 | 15.24,6.03 S1_EN.2 | C21.2 79.85,41.84 79.85,44.29 | C22.2 42.8,5.97 43.18,6.35 | 35.26,5.97 C23.2 35.22,5.97 35.05,6.13 | C24.2 38.92,25.91 39.37,26.35 | C25.2 6.35,36.83 | D9.A 6.99,14.29
  Bottom 0.457: OK1.2 OK1.3 80.01,40.64 | v36.2,40.64 39.69,44.13 45.72,44.13 | 45.72,44.13 50.48,44.13 52.07,45.72 R11.1 | 45.72,44.13 v45.72,40.96 | 80.01,40.64 85.09,40.64 J1.1 | 80.01,40.64 84.14,36.51 84.14,11.43 BT2.N | 4.91,30.22 4.84,30.34 4.76,30.48 2.86,32.38 2.54,32.38 J3.SHLD2 | 4.91,30.22 J3.GND | v15.24,36.51 13.02,34.29 D6.A | R7.1 41.27,19.05 v41.91,19.69 | D7.A 29.21,30.36 v29.21,31.75 | U6.2 7.37,26.67 6.73,27.3 6.73,29.84 6.36,30.22 4.91,30.22
  pour Top (isolate 0.61): 0,48.26 3.81,52.07 83.82,52.07 85.09,52.07 88.9,48.26 88.9,5.08 83.82,0 69.85,0 66.04,3.81 66.04,24.13 63.5,26.67 45.72,26.67 41.91,22.86 41.91,6.35 35.56,0 3.81,0 0,3.81
  pour Bottom (isolate 0.61): 0,1.27 1.27,0 38.1,0 41.91,3.81 41.91,22.86 45.72,26.67 64.77,26.67 66.04,25.4 66.04,5.08 71.12,0 87.63,0 88.9,1.27 88.9,49.53 87.63,50.8 86.36,52.07 1.27,52.07 0,50.8 0,49.53
GPIO_14
  Top 0.457: C20.1 R13.1 73.98,45.72 | 73.98,45.72 73.98,46.99 71.44,46.99 69.22,44.77 69.22,21.59 63.82,21.59 U2.13 | OK1.4 73.98,44.77 73.98,45.72
GPIO_25  (via drill 0.6)
  Top 0.457: 2.54,40.64 2.54,39.05 R27.2 | v49.85,36.83 49.85,37.46 48.26,37.46 R3.1 | v61.59,18.41 62.23,17.78 63.5,17.78 U2.10 | 2.54,40.64 2.86,40.96 v2.86,42.55 | 2.54,40.64 R26.1
  Bottom 0.457: 49.85,32.7 49.85,30.16 49.21,29.53 49.21,26.99 56.83,26.99 63.18,20.64 63.18,18.41 v61.59,18.41 | 49.85,32.7 v49.85,36.83 | v2.86,42.55 7.3,46.99 27.94,46.99 42.23,32.7 49.85,32.7
GPIO_27  (via drill 0.6)
  Top 0.457: R23.1 9.53,43.81 U5.5 v14.61,43.81 | v61.59,20.32 63.5,20.32 U2.12
  Bottom 0.457: v61.59,20.32 55.88,26.03 42.86,26.03 25.08,43.81 v14.61,43.81
GPIO_32  (via drill 0.6)
  Top 0.457: v61.91,26.35 61.91,40 59.69,42.23 R28.1 | v65.72,19.37 65.09,18.73 65.09,15.56 64.77,15.24 63.82,15.24 U2.8
  Bottom 0.457: v61.91,26.35 61.91,23.18 v65.72,19.37
GPIO_33  (via drill 0.6)
  Top 0.457: v50.16,42.55 50.16,43.81 45.72,43.81 R6.1 | v61.59,16.51 63.5,16.51 U2.9
  Bottom 0.457: v50.16,42.55 51.12,43.5 57.47,43.5 68.9,32.07 68.9,16.51 v61.59,16.51
N$1
  Top 0.457: 40.64,38.1 R2.2 | R1.1 40.64,38.1 | 40.64,38.1 40.64,39.69 Q1.B | 40.64,38.1 41.43,38.89 | 41.43,38.89 43.18,40.64 Q2.C | C3.1 41.59,38.42 41.59,38.73 41.43,38.89
N$2  (via drill 0.6)
  Top 0.457: v75.56,43.18 75.56,40.32 77.79,38.1 R12.1
  Bottom 0.457: v75.56,43.18 73.98,44.77 66.36,44.77 OK1.1
N$3
  Top 0.457: 38.89,34.13 35.56,30.8 R8.1 | 38.89,34.13 40.64,35.88 R1.2 | 38.89,34.13 34.61,38.42 34.61,42.23 36.51,42.23 38.1,40.64 Q1.C
N$4
  Top 0.457: R6.2 45.72,42.55 44.13,42.55 44.13,42.86 Q2.B
N$5  (via drill 0.6)
  Top 0.457: v23.18,23.18 23.18,24.77 23.5,25.08 U1.1 | F1.2 8.89,15.72 D6.C 8.89,20.45 8.17,21.17 C1.1
  Bottom 0.457: v23.18,23.18 22.86,22.86 15.24,22.86 | 15.24,22.86 10.16,22.86 8.89,21.59 D6.C | U6.5 13.34,26.67 15.24,24.77 15.24,22.86
N$6
  Top 0.457: R4.2 R5.2 45.72,34.92 43.18,34.92 C3.2
N$7
  Top 0.457: D3.C 25.4,20.32 25.4,21.59 D2.A 25.4,21.91 24.77,22.54 U1.2
N$8
  Top 0.457: R5.1 45.72,33.66 48.26,33.66 Q4.E
N$9
  Top 0.457: R3.2 48.26,35.24 Q4.B
N$10
  Top 0.457: D5.A 26.99,16.51 26.99,17.78 D4.C 26.99,18.1 26.99,20 D3.A 27.3,20.32 | 27.3,20.32 27.3,21.59 D2.C | 27.3,20.32 29.84,22.86 29.84,25.08 27.3,25.08 U1.4
N$11
  Top 0.457: Q3.C 56.52,40 52.07,40 C2.1 R9.1 52.07,35.56 50.8,34.29 Q4.C 51.12,34.29 51.12,32.7 R10.1
N$12
  Top 0.457: R28.2 58.42,42.23 57.47,42.23 Q3.B
N$13  (via drill 0.6)
  Top 0.457: D5.C 25.4,16.51 25.4,17.78 D4.A 25.08,18.1 v23.81,19.37 | v28.26,23.18 26.04,23.18 U1.3
  Bottom 0.457: v23.81,19.37 27.62,23.18 v28.26,23.18
N$14  (via drill 0.6)
  Top 0.457: v14.61,16.83 14.61,15.24 R18.2 | v17.78,12.38 19.05,12.38 19.05,11.75 Q6.2 | v11.43,20 9.84,21.59 9.84,24.45 11.11,24.45 U4.4
  Bottom 0.457: v17.78,12.38 14.61,12.38 v14.61,16.83 v11.43,20
N$15
  Top 0.457: R10.2 R9.2
  Bottom 0.457: R8.2 51.75,30.16 65.72,30.16 R10.2 | D1.C 69.85,36.83 R9.2
N$16
  Top 0.457: R11.2 52.07,43.18 C2.2
N$17
  Top 0.457: U1.7 24.77,34.29 L1.P$1
N$18
  Top 0.457: 82.55,35.24 79.69,38.1 | D1.A 82.55,35.24 | 79.69,38.1 R12.2 | 82.55,35.24 85.09,37.78 J1.2 | C21.1 79.69,39.85 79.69,38.1
N$19  (via drill 0.6)
  Top 0.457: 26.35,33.66 C4.1 27.94,33.66 v27.94,35.56 | 26.35,33.66 26.35,34.29 L1.P$2 26.35,33.66 | 26.35,33.66 26.35,31.12 26.04,30.8 U1.6 | v33.66,29.84 33.97,29.53 33.97,21.91 34.92,20.95 34.92,17.78 v24.45,7.3 | F2.1 3.72,7.3 v9.21,7.3 7.68,7.3 D9.C
  Bottom 0.457: v33.66,29.84 v27.94,35.56 | v9.21,7.3 v24.45,7.3
N$20  (via drill 0.6)
  Top 0.457: v24.45,10.79 24.13,11.11 24.13,17.78 22.23,17.78 20.95,16.51 20.95,15.24 R19.2 | v13.34,10.16 13.02,10.48 13.02,11.75 Q5.2 12.7,11.75 11.75,12.7 11.75,18.41 16.51,23.18 U4.6
  Bottom 0.457: v24.45,10.79 24.13,10.48 13.65,10.48 v13.34,10.16
N$21
  Top 0.457: JP3.1 5.08,25.4 J3.D-
N$22
  Top 0.457: JP4.1 5.08,27.94 J3.D+
N$23  (via drill 0.6)
  Top 0.457: R15.2 21.59,26.67 21.59,19.69 v21.91,19.37 | v47.62,17.15 47.31,16.83 47.31,10.79 46.67,10.16 45.72,10.16 U2.35 45.4,10.16 R16.1
  Bottom 0.457: v21.91,19.37 24.13,17.15 v47.62,17.15
N$24  (via drill 0.6)
  Top 0.457: v18.1,14.92 18.1,15.24 20.32,17.46 20.32,24.77 19.68,25.4 R14.2 | v43.5,12.06 44.13,11.43 45.4,11.43 U2.34
  Bottom 0.457: v18.1,14.92 20.64,12.38 43.18,12.38 v43.5,12.06
N$25
  Top 0.457: R17.1 43.5,17.78 45.4,17.78 U2.29
N$26
  Top 0.457: R19.1 19.68,15.24 19.68,13.97 19.37,13.65 Q6.1
N$27
  Top 0.457: R18.1 13.34,15.24 13.02,14.92 13.02,13.65 Q5.1
N$28
  Top 0.457: R24.2 44.13,24.77 45.4,23.49 45.4,22.86 U2.25
N$29  (via drill 0.6)
  Top 0.457: 15.24,12.7 15.24,13.33 16.51,13.33 R20.1 | 15.24,12.7 S1_EN.1 15.24,8.89 v17.46,8.89 | 15.24,12.7 Q5.3 | v59.69,8.89 63.5,8.89 U2.3
  Bottom 0.457: v17.46,8.89 v59.69,8.89
N$30
  Top 0.457: U5.3 10.79,46.35 9.84,47.31 5.08,47.31 5.08,49.53 J4.1
N$31
  Top 0.457: U5.1 7.94,48.89 7.94,49.53 J4.2
N$32
  Top 0.457: U5.14 19.68,46.35 20.64,47.31 25.4,47.31 25.4,49.53 J5.1
N$33
  Top 0.457: U5.16 22.54,48.89 22.54,49.53 J5.2
N$34
  Top 0.457: U5.12 R22.1
N$35  (via drill 0.6)
  Top 0.457: 21.59,12.7 21.59,13.33 22.86,13.33 R21.1 | v40.96,26.03 43.81,26.03 R24.1 | v33.34,20.64 33.34,17.46 25.08,9.21 22.86,9.21 S2_FLASH.1 22.86,11.43 21.59,12.7 | 21.59,12.7 Q6.3
  Bottom 0.457: v40.96,26.03 35.56,20.64 v33.34,20.64
N$36  (via drill 0.6)
  Top 0.457: v15.56,39.69 14.61,38.73 14.61,38.1 C17.2 | v11.43,38.42 12.06,39.05 12.06,40 U5.8
  Bottom 0.457: v15.56,39.69 14.92,39.05 12.06,39.05 v11.43,38.42
N$37
  Top 0.457: 9.53,40.64 9.53,39.37 JP1.1 | 9.53,40.64 10.48,40.64 11.11,41.27 U5.7 | 9.53,40.64 R25.2
N$38
  Top 0.457: U4.8 R14.1
N$39
  Top 0.457: R15.1 18.1,26.67 17.78,26.35 16.83,26.35 U4.9
N$40
  Top 0.457: C18.2 R25.1
N$41  (via drill 0.6)
  Top 0.457: v7.62,38.73 7.62,38.1 9.53,38.1 JP1.2 | v15.88,41.59 16.83,41.59 17.14,41.27 U5.10
  Bottom 0.457: v7.62,38.73 8.57,39.69 10.79,39.69 12.7,41.59 v15.88,41.59
N$42
  Top 0.457: R26.2 C18.1
N$43  (via drill 0.6)
  Top 0.457: v5.08,17.78 5.08,15.22 F1.1
  Bottom 0.457: J3.VBUS 5.08,23.03 v5.08,17.78
N$44  (via drill 0.6)
  Top 0.457: F2.2 2.67,13.06 v2.67,16
  Bottom 0.457: v2.67,16 2.67,12.57 3.81,11.43 BT2.P
USBU_DM  (via drill 0.6)
  Top 0.457: 8.89,25.4 9.84,25.4 9.84,26.03 10.16,26.35 11.11,26.35 U4.2 | 8.89,25.4 JP3.2 | v8.37,23.75 8.89,24.27 8.89,25.4
  Bottom 0.457: U6.1 8.91,24.29 v8.37,23.75
USBU_DP  (via drill 0.6)
  Top 0.457: 9.14,27.94 11.11,27.94 11.11,27.62 U4.1 | 9.14,27.94 JP4.2 | v9.14,29.46 9.14,27.94
  Bottom 0.457: U6.3 9.14,27.85 v9.14,29.46